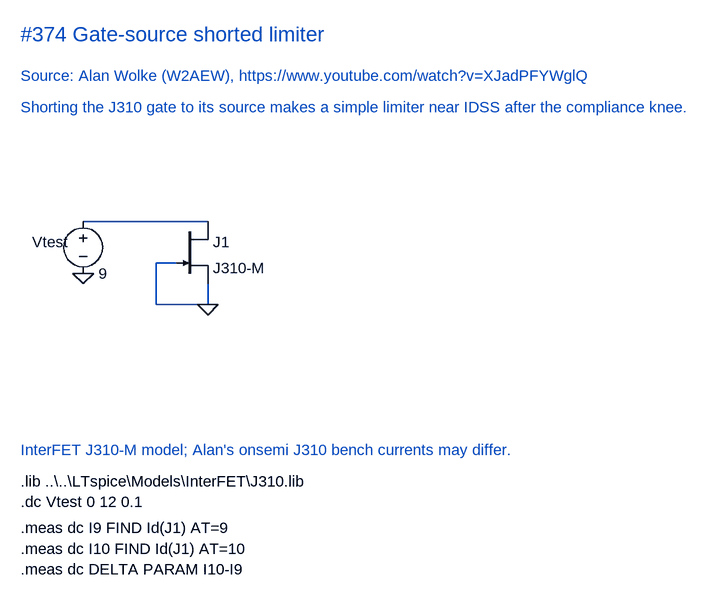
[diagram p0: schematic Gate-source shorted limiter.asc]
Gate-source shorted limiter.asc, the LTspice schematic file:
Version 4.1
SHEET 1 960 920
WIRE 128 320 320 320
WIRE 320 448 320 416
WIRE 240 384 272 384
WIRE 240 448 240 384
WIRE 320 448 240 448
FLAG 128 400 0
FLAG 320 448 0
SYMBOL voltage 128 304 R0
WINDOW 0 -24 48 Right 2
SYMATTR InstName Vtest
SYMATTR Value 9
SYMBOL njf 272 320 R0
SYMATTR InstName J1
SYMATTR Value J310-M
TEXT 32 32 Left 3 ;#374 Gate-source shorted limiter
TEXT 32 96 Left 2 ;Source: Alan Wolke (W2AEW), https://www.youtube.com/watch?v=XJadPFYWglQ
TEXT 32 144 Left 2 ;Shorting the J310 gate to its source makes a simple limiter near IDSS after the compliance knee.
TEXT 32 672 Left 2 ;InterFET J310-M model; Alan's onsemi J310 bench currents may differ.
TEXT 32 720 Left 2 !.lib ..\..\LTspice\Models\InterFET\J310.lib
TEXT 32 752 Left 2 !.dc Vtest 0 12 0.1
TEXT 32 792 Left 2 !.meas dc I9 FIND Id(J1) AT=9
TEXT 32 824 Left 2 !.meas dc I10 FIND Id(J1) AT=10
TEXT 32 856 Left 2 !.meas dc DELTA PARAM I10-I9

The netlist it stands for:
* Gate-source shorted limiter.asc
Vtest N001 0 9
J1 N001 0 0 J310-M
.model NJF NJF
.model PJF PJF
.lib standard.jft
* #374 Gate-source shorted limiter
* Source: Alan Wolke (W2AEW), https://www.youtube.com/watch?v=XJadPFYWglQ
* Shorting the J310 gate to its source makes a simple limiter near IDSS after the compliance knee.
* InterFET J310-M model; Alan's onsemi J310 bench currents may differ.
.lib ..\..\LTspice\Models\InterFET\J310.lib
.dc Vtest 0 12 0.1
.meas dc I9 FIND Id(J1) AT=9
.meas dc I10 FIND Id(J1) AT=10
.meas dc DELTA PARAM I10-I9
.backanno
.end